# Altium schematic sheet PCIe_Sheet.SchDoc
size A4; DocumentNumber: 17; SheetNumber: 17; SheetTotal: 27
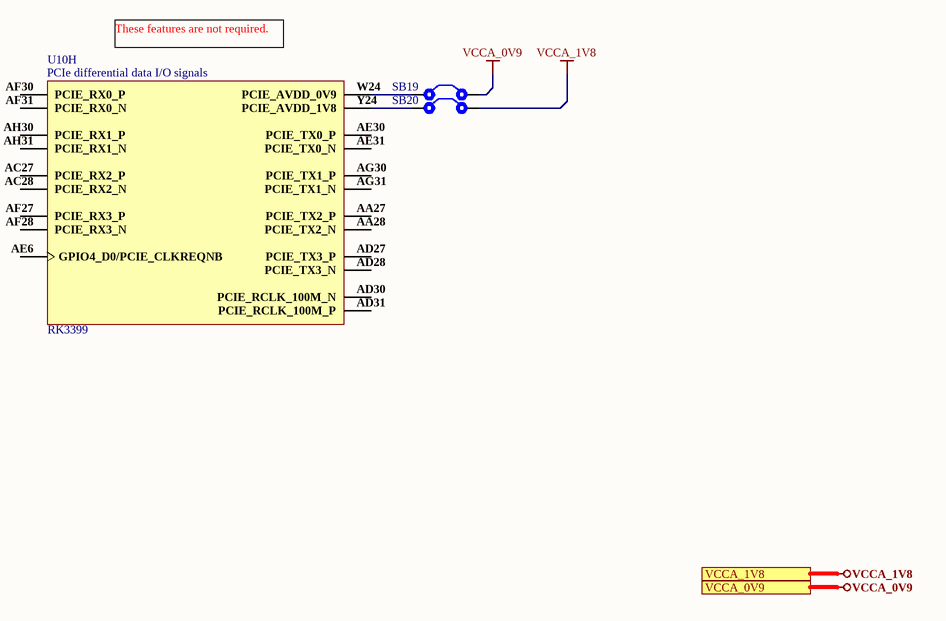
[diagram p0: PCIe_Sheet.SchDoc]

## Parts
SB19  Solder Bridge  [Solder Bridge]  (value not drawn)
SB20  Solder Bridge  [Solder Bridge]  (value not drawn)
U10  RK3399  [RK3399]  (part H of 34)

## Ports
VCCA_0V9, VCCA_1V8

## Nets
VCCA_0V9: SB19.2 ; port VCCA_0V9
VCCA_1V8: SB20.2 ; port VCCA_1V8
NetSB19_1: SB19.1 U10.W24(PCIE_AVDD_0V9)
NetSB20_1: SB20.1 U10.Y24(PCIE_AVDD_1V8)

Not connected (* = marked no-connect by the designer): U10 AA27(PCIE_TX2_P) AA28(PCIE_TX2_N) AC27(PCIE_RX2_P) AC28(PCIE_RX2_N) AD27(PCIE_TX3_P) AD28(PCIE_TX3_N) AD30(PCIE_RCLK_100M_N) AD31(PCIE_RCLK_100M_P) AE6(GPIO4_D0/PCIE_CLKREQNB) AE30(PCIE_TX0_P) AE31(PCIE_TX0_N) AF27(PCIE_RX3_P) AF28(PCIE_RX3_N) AF30(PCIE_RX0_P) AF31(PCIE_RX0_N) AG30(PCIE_TX1_P) AG31(PCIE_TX1_N) AH30(PCIE_RX1_P) AH31(PCIE_RX1_N)

## Notes on the sheet
- (near U10) These features are not required.
- 1
- Huzaifa Ali
- (in symbol RK3399, part H) PCIe differential data I/O signals

## Library data of the parts
SB19 SB20 = Solder Bridge: Solder Bridge ON
U10 = RK3399: RK3399 CPU BGA for HD set-top box chip BGA Chipse; Manufacturer: Fuzhou Rockchip Electronics; ComponentLink1Description: Aliexpress; ComponentLink1URL: https://www.aliexpress.com/item/1005001971093459.html?spm=a2g0n.productlist.0.0.3c7csv8Qsv8Quh&browser_id=3ac7e9efb8074641aaabc4d871f09748&aff_trace_key=&aff_platform=msite&m_page_id=181389a08711fc2600d8cc522bab8d702dd4189be0&gclid=&pdp_npi=2%40dis%21USD%21%2123.6%21%21%21%21%21%402101d91e16545120399167831e8b89%21%21sea&algo_pvid=4303aedd-774c-4013-953d-920f10b55003; Manufacturer Part Number: RK3399; Footprint: FCBGA828